# Altium schematic sheet power_tree.SchDoc
size A4; SheetNumber: 2; SheetTotal: 3
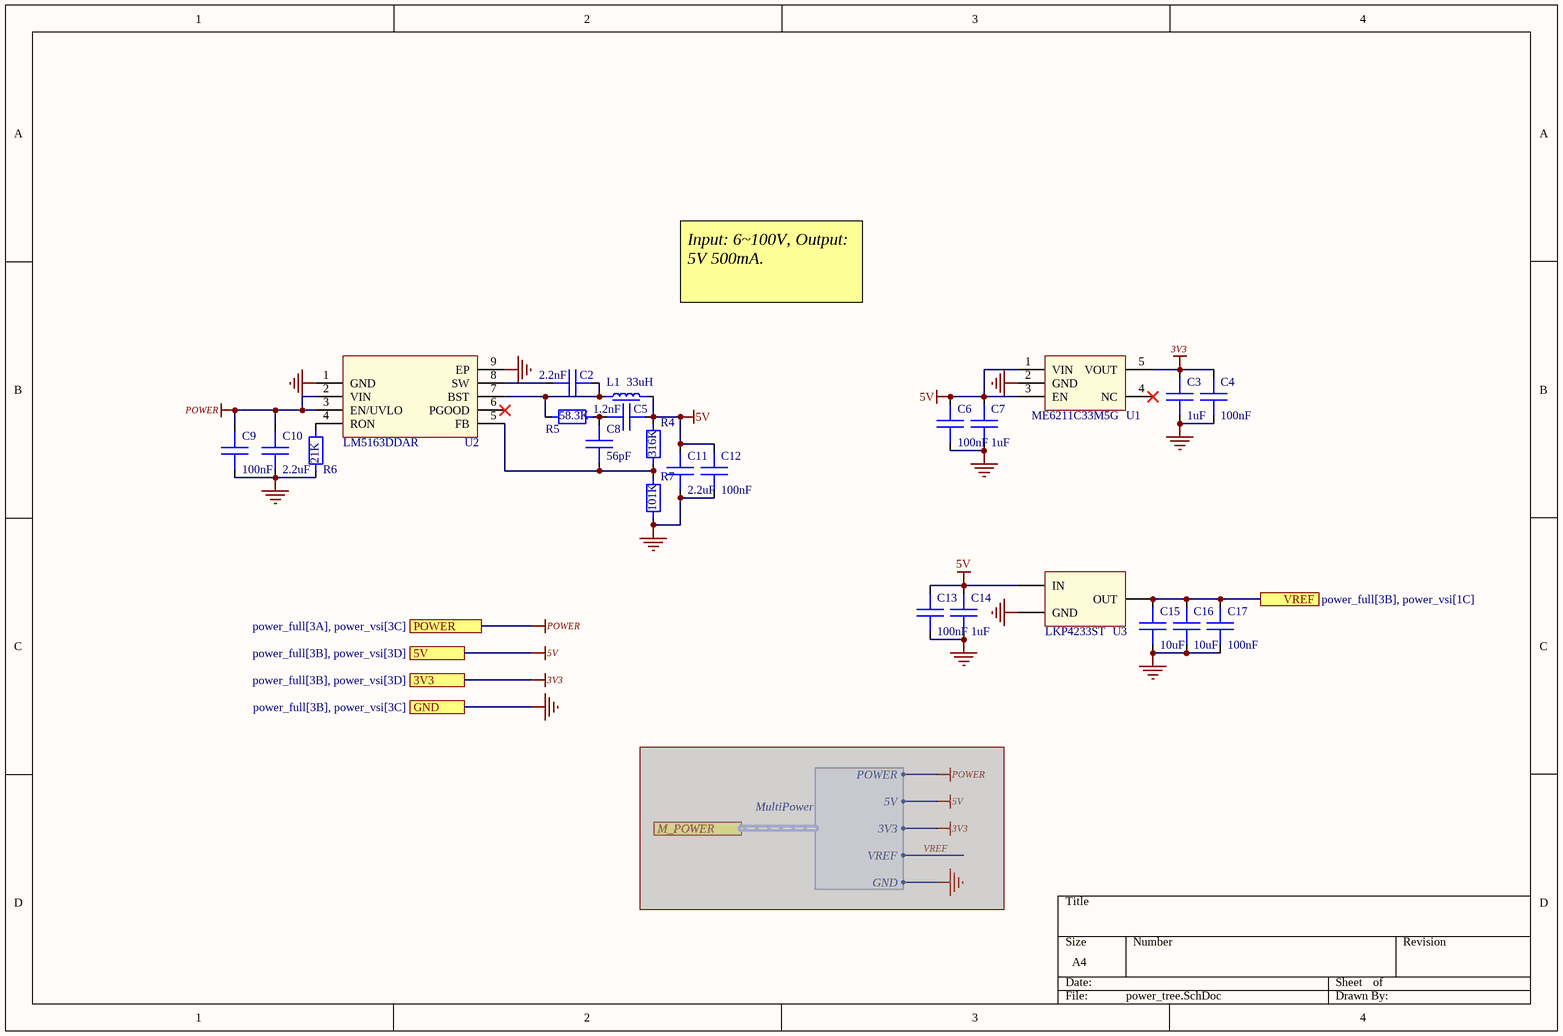
[diagram p0: power_tree.SchDoc]

## Parts
C2  2.2nF  [C0603]
C3  1uF  [C0402]
C4  100nF  [C0402]
C5  1.2nF  [C0603]
C6  100nF  [C0402]
C7  1uF  [C0402]
C8  56pF  [C0603]
C9  100nF  [C0603]
C10  2.2uF  [C1206]
C11  2.2uF  [C0603]
C12  100nF  [C0603]
C13  100nF  [C0402]
C14  1uF  [C0402]
C15  10uF  [C0402]
C16  10uF  [C0402]
C17  100nF  [C0402]
L1  33uH  [IND-SMD6028]
R4  316K  [R0603]
R5  58.3K  [R0603]
R6  21K  [R0603]
R7  101K  [R0603]
U1  ME6211C33M5G  [SOT23-5]
U2  LM5163DDAR  [SOIC8-EP]
U3  LKP4233ST  [SOT23-3]

## Ports
3V3 (see power_full[3B], power_vsi[3D]), 5V (see power_full[3B], power_vsi[3D]), GND (see power_full[3B], power_vsi[3C]), M_POWER (harness MultiPower), POWER (see power_full[3A], power_vsi[3C]), VREF (see power_full[3B], power_vsi[1C])

## Harnesses
MultiPower: POWER, 5V, 3V3, VREF, GND

## Nets
3V3: C3.2 C4.2 U1.5(VOUT) ; port 3V3
5V: C5.1 C6.2 C7.2 C11.2 C12.2 C13.2 C14.2 L1.2 R4.2 U1.1(VIN) U1.3(EN) U3.1(IN) ; port 5V
GND: C3.1 C4.1 C6.1 C7.1 C9.1 C10.1 C11.1 C12.1 C13.1 C14.1 C15.1 C16.1 C17.1 R6.1 R7.1 U1.2(GND) U2.1(GND) U2.9(EP) U3.3(GND) ; port GND
POWER: C9.2 C10.2 U2.2(VIN) U2.3(EN/UVLO) ; port POWER
VREF: C15.2 C16.2 C17.2 U3.2(OUT) ; port VREF
NetC2_1: C2.1 L1.1 R5.2 U2.7(BST)
NetC2_2: C2.2 U2.8(SW)
NetC5_2: C5.2 C8.2 R5.1
NetC8_1: C8.1 R4.1 R7.2 U2.5(FB)
NetR6_2: R6.2 U2.4(RON)

Not connected (* = marked no-connect by the designer): U1 4(NC)*; U2 6(PGOOD)*

## Notes on the sheet
- Input: 6~100V, Output: 5V 500mA.

## Library data of the parts
C2 C5 C8 = Capacitor: 50V 5%
C3 C4 C6 C7 C11-C14 C17 = Capacitor: 16V 10%
C9 C10 = Capacitor: 100V 10%
C15 C16 = Capacitor: 10V 10%
L1 = Inductor
R4 R6 R7 = Resistance: 1%
R5 = Resistance: 5%
U2 = LM516xDDAR
U3 = LKP42xxST